# Altium schematic sheet huge.SchDoc
size A4
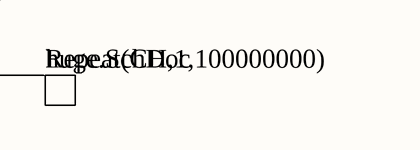
[diagram p0: huge.SchDoc]

## Sub-sheets
Repeat(CH,1,100000000) = huge.SchDoc: no entries